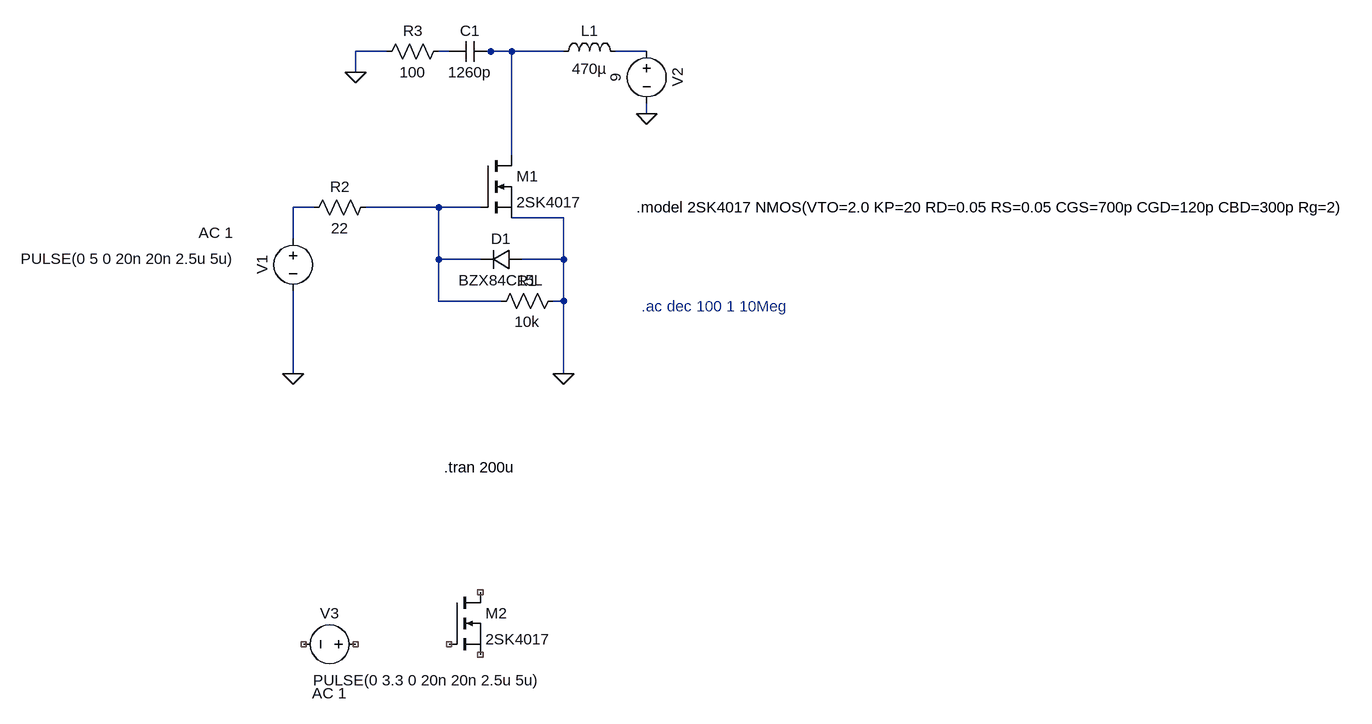
[diagram p0: schematic Draft1.asc]
Draft1.asc, the LTspice schematic file:
Version 4.1
SHEET 1 1580 1036
WIRE 32 32 -16 32
WIRE 128 32 112 32
WIRE 192 32 176 32
WIRE 224 32 192 32
WIRE 304 32 224 32
WIRE 432 32 384 32
WIRE -16 64 -16 32
WIRE 432 128 432 112
WIRE 224 192 224 32
WIRE -80 272 -112 272
WIRE 112 272 0 272
WIRE 176 272 112 272
WIRE 304 288 224 288
WIRE -112 320 -112 272
WIRE 112 352 112 272
WIRE 176 352 112 352
WIRE 304 352 304 288
WIRE 304 352 240 352
WIRE 112 416 112 352
WIRE 208 416 112 416
WIRE 304 416 304 352
WIRE 304 416 288 416
WIRE -112 528 -112 400
WIRE 304 528 304 416
FLAG -112 528 0
FLAG 432 128 0
FLAG 304 528 0
FLAG -16 64 0
SYMBOL nmos 176 192 R0
SYMATTR InstName M1
SYMATTR Value 2SK4017
SYMBOL voltage -112 304 R0
WINDOW 0 -32 56 VBottom 2
WINDOW 3 -254 31 Top 2
WINDOW 123 -119 -9 Top 2
WINDOW 39 0 0 Left 0
SYMATTR InstName V1
SYMATTR Value PULSE(0 5 0 20n 20n 2.5u 5u)
SYMATTR Value2 AC 1
SYMBOL voltage 432 16 R0
WINDOW 0 32 56 VTop 2
WINDOW 3 -32 56 VBottom 2
WINDOW 123 0 0 Left 0
WINDOW 39 0 0 Left 0
SYMATTR InstName V2
SYMATTR Value 9
SYMBOL res 304 400 R90
WINDOW 0 0 56 VBottom 2
WINDOW 3 32 56 VTop 2
SYMATTR InstName R1
SYMATTR Value 10k
SYMBOL res -96 288 R270
WINDOW 0 32 56 VTop 2
WINDOW 3 0 56 VBottom 2
SYMATTR InstName R2
SYMATTR Value 22
SYMBOL cap 192 16 R90
WINDOW 0 0 32 VBottom 2
WINDOW 3 32 32 VTop 2
SYMATTR InstName C1
SYMATTR Value 1260p
SYMBOL ind 288 48 R270
WINDOW 0 32 56 VTop 2
WINDOW 3 5 56 VBottom 2
SYMATTR InstName L1
SYMATTR Value 470µ
SYMATTR SpiceLine Rser=1m
SYMBOL res 128 16 R90
WINDOW 0 0 56 VBottom 2
WINDOW 3 32 56 VTop 2
SYMATTR InstName R3
SYMATTR Value 100
SYMBOL voltage 0 944 R90
WINDOW 0 -32 56 VBottom 2
WINDOW 3 40 -94 VTop 2
WINDOW 123 60 56 VTop 2
WINDOW 39 0 0 Left 0
SYMATTR InstName V3
SYMATTR Value PULSE(0 3.3 0 20n 20n 2.5u 5u)
SYMATTR Value2 AC 1
SYMBOL nmos 128 864 R0
SYMATTR InstName M2
SYMATTR Value 2SK4017
SYMBOL diode 240 336 R90
WINDOW 0 0 32 VBottom 2
WINDOW 3 32 32 VTop 2
SYMATTR InstName D1
SYMATTR Value BZX84C15L
TEXT 120 672 Left 2 !.tran 200u
TEXT 416 272 Left 2 !.model 2SK4017 NMOS(VTO=2.0 KP=20 RD=0.05 RS=0.05 CGS=700p CGD=120p CBD=300p Rg=2)
TEXT 424 424 Left 2 ;.ac dec 100 1 10Meg

The netlist it stands for:
* Draft1.asc
M1 N002 N005 0 0 2SK4017
V1 N004 0 PULSE(0 5 0 20n 20n 2.5u 5u) AC 1
V2 N003 0 9
R1 0 N005 10k
R2 N004 N005 22
C1 N002 N001 1260p
L1 N002 N003 470µ Rser=1m
R3 N001 0 100
V3 NC_01 NC_02 PULSE(0 3.3 0 20n 20n 2.5u 5u) AC 1
M2 NC_03 NC_04 NC_05 NC_05 2SK4017
D1 0 N005 BZX84C15L
.model D D
.lib standard.dio
.model NMOS NMOS
.model PMOS PMOS
.lib standard.mos
.tran 200u
.model 2SK4017 NMOS(VTO=2.0 KP=20 RD=0.05 RS=0.05 CGS=700p CGD=120p CBD=300p Rg=2)
* .ac dec 100 1 10Meg
.backanno
.end